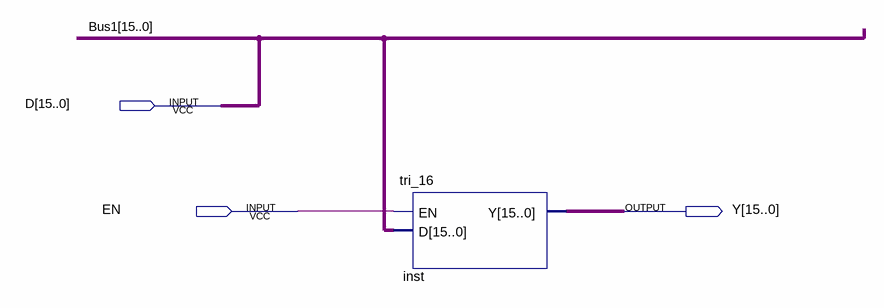
[diagram p0: schematic sheet]
// Quartus schematic test_tri.bdf as structural Verilog: 1 symbols, 3 pins
module test_tri (
  input  [15:0] D,
  input  EN,
  output [15:0] Y
);

  tri_16 inst (.EN(EN), .D(D), .Y(Y));

  // Other names for the same wires on the sheet: Bus1[15:0] = D
endmodule
